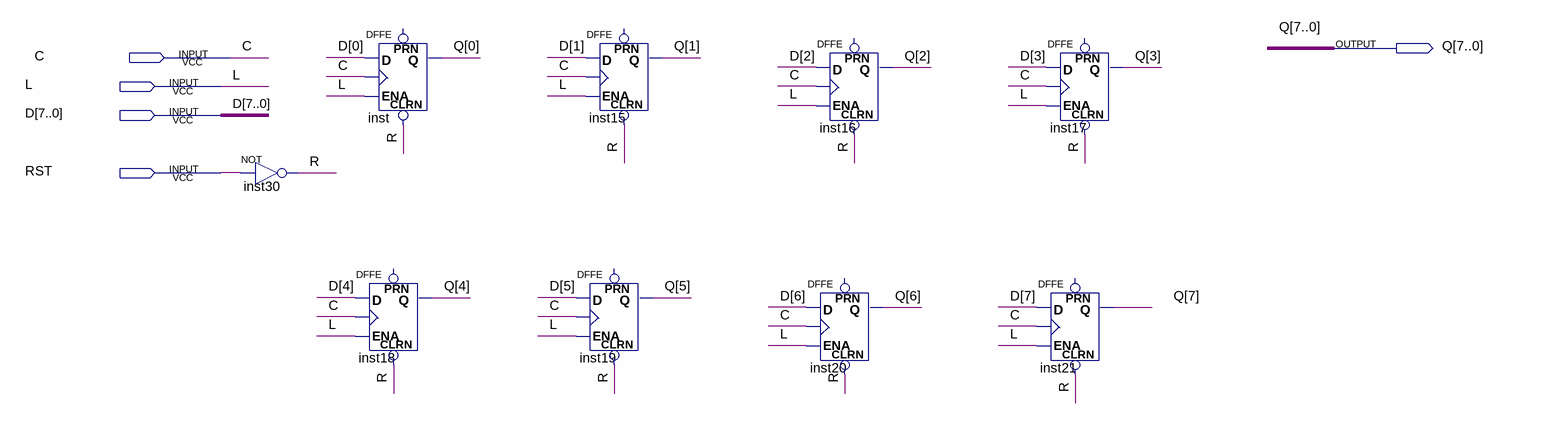
[diagram p0: schematic sheet]
// Quartus schematic REG8.bdf as structural Verilog: 9 symbols, 5 pins
module REG8 (
  input  C,
  input  L,
  input  [7:0] D,
  input  RST,
  output [7:0] Q
);

  wire R;

  not inst30 (R, RST);
  DFFE inst (.CLRN(R), .D(D[0]), .CLK(C), .ENA(L), .Q(Q[0]));  // open: PRN
  DFFE inst18 (.CLRN(R), .D(D[4]), .CLK(C), .ENA(L), .Q(Q[4]));  // open: PRN
  DFFE inst15 (.CLRN(R), .D(D[1]), .CLK(C), .ENA(L), .Q(Q[1]));  // open: PRN
  DFFE inst19 (.CLRN(R), .D(D[5]), .CLK(C), .ENA(L), .Q(Q[5]));  // open: PRN
  DFFE inst16 (.CLRN(R), .D(D[2]), .CLK(C), .ENA(L), .Q(Q[2]));  // open: PRN
  DFFE inst20 (.CLRN(R), .D(D[6]), .CLK(C), .ENA(L), .Q(Q[6]));  // open: PRN
  DFFE inst17 (.CLRN(R), .D(D[3]), .CLK(C), .ENA(L), .Q(Q[3]));  // open: PRN
  DFFE inst21 (.CLRN(R), .D(D[7]), .CLK(C), .ENA(L), .Q(Q[7]));  // open: PRN
endmodule
